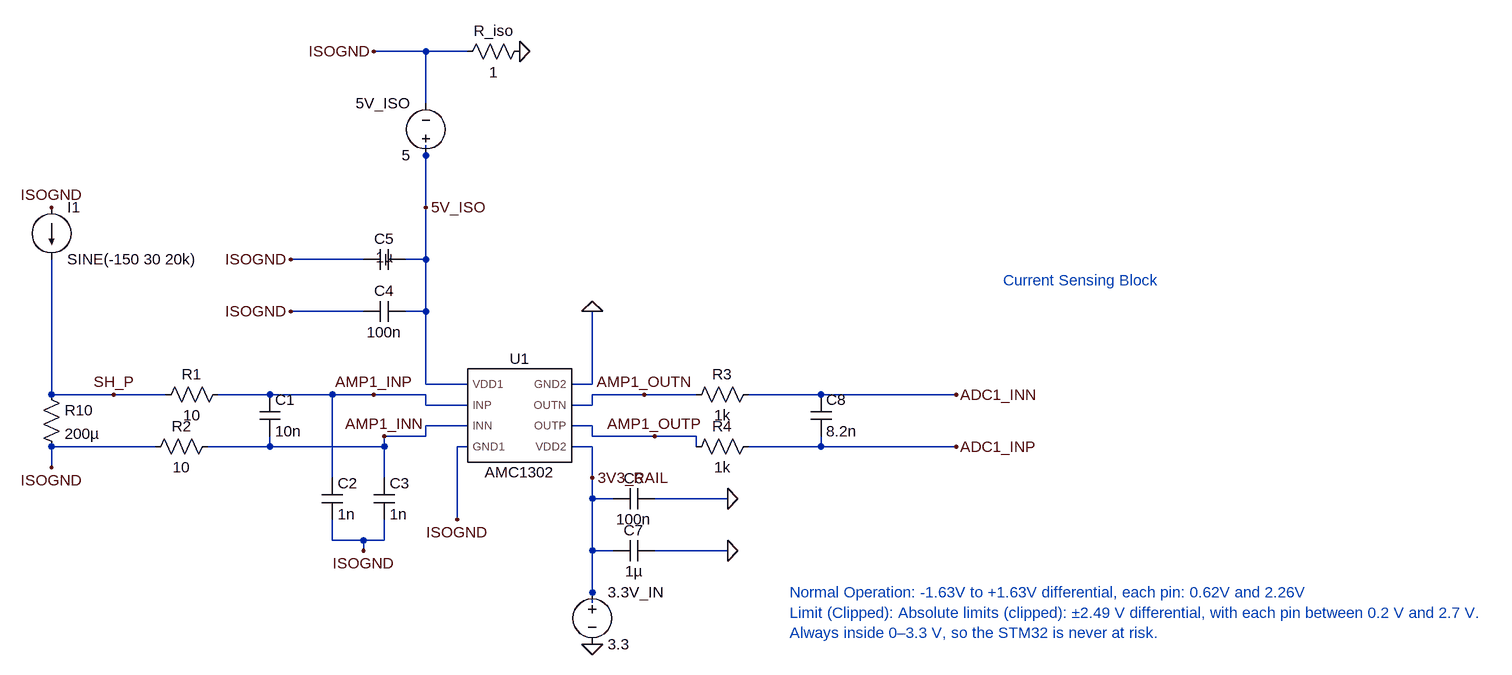
[diagram p0: schematic current_block1.asc]
current_block1.asc, the LTspice schematic file:
Version 4.1
SHEET 1 2132 1664
WIRE 384 -368 304 -368
WIRE 448 -368 384 -368
WIRE 384 -288 384 -368
WIRE 384 -208 384 -224
WIRE 384 -128 384 -208
WIRE 288 -48 176 -48
WIRE 384 -48 384 -128
WIRE 384 -48 352 -48
WIRE 288 32 176 32
WIRE 384 32 384 -48
WIRE 384 32 352 32
WIRE 384 144 384 32
WIRE 448 144 384 144
WIRE 640 144 640 32
WIRE 640 144 608 144
WIRE -192 160 -192 -48
WIRE -96 160 -192 160
WIRE -16 160 -96 160
WIRE 144 160 64 160
WIRE 240 160 144 160
WIRE 304 160 240 160
WIRE 384 160 304 160
WIRE 720 160 640 160
WIRE 800 160 720 160
WIRE 992 160 880 160
WIRE 1200 160 992 160
WIRE 384 176 384 160
WIRE 448 176 384 176
WIRE 640 176 640 160
WIRE 640 176 608 176
WIRE 448 208 384 208
WIRE 640 208 608 208
WIRE 384 224 384 208
WIRE 384 224 320 224
WIRE 640 224 640 208
WIRE 736 224 640 224
WIRE 800 224 736 224
WIRE -32 240 -192 240
WIRE 144 240 144 224
WIRE 144 240 48 240
WIRE 320 240 320 224
WIRE 320 240 144 240
WIRE 448 240 432 240
WIRE 640 240 608 240
WIRE 800 240 800 224
WIRE 992 240 992 224
WIRE 992 240 880 240
WIRE 1200 240 992 240
WIRE -192 272 -192 240
WIRE 240 288 240 160
WIRE 320 288 320 240
WIRE 640 288 640 240
WIRE 640 320 640 288
WIRE 672 320 640 320
WIRE 848 320 736 320
WIRE 432 352 432 240
WIRE 240 384 240 352
WIRE 288 384 240 384
WIRE 320 384 320 352
WIRE 320 384 288 384
WIRE 288 400 288 384
WIRE 640 400 640 320
WIRE 672 400 640 400
WIRE 848 400 736 400
WIRE 640 464 640 400
WIRE 640 480 640 464
FLAG 176 -48 ISOGND
FLAG 176 32 ISOGND
FLAG 432 352 ISOGND
FLAG 848 400 0
FLAG 848 320 0
FLAG 640 32 0
FLAG 1200 160 ADC1_INN
FLAG 1200 240 ADC1_INP
FLAG 288 400 ISOGND
FLAG 304 -368 ISOGND
FLAG 640 544 0
FLAG 528 -368 0
FLAG -192 -128 ISOGND
FLAG -192 272 ISOGND
FLAG -96 160 SH_P
FLAG 304 160 AMP1_INP
FLAG 320 224 AMP1_INN
FLAG 640 288 3V3_RAIL
FLAG 736 224 AMP1_OUTP
FLAG 720 160 AMP1_OUTN
FLAG 384 -128 5V_ISO
SYMBOL res 80 144 R90
WINDOW 0 0 56 VBottom 2
WINDOW 3 32 56 VTop 2
SYMATTR InstName R1
SYMATTR Value 10
SYMBOL res 64 224 R90
WINDOW 0 0 56 VBottom 2
WINDOW 3 32 56 VTop 2
SYMATTR InstName R2
SYMATTR Value 10
SYMBOL cap 128 160 R0
SYMATTR InstName C1
SYMATTR Value 10n
SYMBOL cap 224 288 R0
SYMATTR InstName C2
SYMATTR Value 1n
SYMBOL cap 304 288 R0
SYMATTR InstName C3
SYMATTR Value 1n
SYMBOL cap 352 16 R90
WINDOW 0 0 32 VBottom 2
WINDOW 3 32 32 VTop 2
SYMATTR InstName C4
SYMATTR Value 100n
SYMBOL cap 352 -64 R90
WINDOW 0 0 32 VBottom 2
WINDOW 3 28 32 VBottom 2
SYMATTR InstName C5
SYMATTR Value 1µ
SYMBOL AMC1302 528 192 R0
SYMATTR InstName U1
SYMBOL cap 672 336 R270
WINDOW 0 32 32 VTop 2
WINDOW 3 0 32 VBottom 2
SYMATTR InstName C6
SYMATTR Value 100n
SYMBOL cap 672 416 R270
WINDOW 0 32 32 VTop 2
WINDOW 3 0 32 VBottom 2
SYMATTR InstName C7
SYMATTR Value 1µ
SYMBOL res 896 224 R90
WINDOW 0 0 56 VBottom 2
WINDOW 3 32 56 VTop 2
SYMATTR InstName R4
SYMATTR Value 1k
SYMBOL res 896 144 R90
WINDOW 0 0 56 VBottom 2
WINDOW 3 32 56 VTop 2
SYMATTR InstName R3
SYMATTR Value 1k
SYMBOL cap 976 160 R0
SYMATTR InstName C8
SYMATTR Value 8.2n
SYMBOL res -208 144 R0
SYMATTR InstName R10
SYMATTR Value 200µ
SYMBOL current -192 -128 R0
WINDOW 123 0 0 Left 0
WINDOW 39 0 0 Left 0
SYMATTR InstName I1
SYMATTR Value SINE(-150 30 20k)
SYMBOL voltage 384 -192 R180
WINDOW 0 24 96 Left 2
WINDOW 3 24 16 Left 2
WINDOW 123 0 0 Left 0
WINDOW 39 0 0 Left 0
SYMATTR InstName 5V_ISO
SYMATTR Value 5
SYMBOL voltage 640 448 R0
WINDOW 123 0 0 Left 0
WINDOW 39 0 0 Left 0
SYMATTR InstName 3.3V_IN
SYMATTR Value 3.3
SYMBOL res 544 -384 R90
WINDOW 0 0 56 VBottom 2
WINDOW 3 32 56 VTop 2
SYMATTR InstName R_iso
SYMATTR Value 1
TEXT 1272 -16 Left 2 ;Current Sensing Block
TEXT 944 464 Left 2 ;Normal Operation: -1.63V to +1.63V differential, each pin: 0.62V and 2.26V\nLimit (Clipped): Absolute limits (clipped): ±2.49 V differential, with each pin between 0.2 V and 2.7 V. \nAlways inside 0–3.3 V, so the STM32 is never at risk.

The netlist it stands for:
* current_block1.asc
R1 AMP1_INP SH_P 10
R2 AMP1_INN ISOGND 10
C1 AMP1_INP AMP1_INN 10n
C2 AMP1_INP ISOGND 1n
C3 AMP1_INN ISOGND 1n
C4 5V_ISO ISOGND 100n
C5 5V_ISO ISOGND 1µ
X§U1 5V_ISO AMP1_INP AMP1_INN ISOGND 0 AMP1_OUTN AMP1_OUTP 3V3_RAIL AMC1302  ; pins VDD1 INP INN GND1 GND2 OUTN OUTP VDD2
C6 3V3_RAIL 0 100n
C7 3V3_RAIL 0 1µ
R4 ADC1_INP AMP1_OUTP 1k
R3 ADC1_INN AMP1_OUTN 1k
C8 ADC1_INN ADC1_INP 8.2n
R10 SH_P ISOGND 200µ
I1 ISOGND SH_P SINE(-150 30 20k)
V§5V_ISO 5V_ISO ISOGND 5
V§3.3V_IN 3V3_RAIL 0 3.3
R_iso 0 ISOGND 1
* Current Sensing Block
* Normal Operation: -1.63V to +1.63V differential, each pin: 0.62V and 2.26V
* Limit (Clipped): Absolute limits (clipped): ±2.49 V differential, with each pin between 0.2 V and 2.7 V.
* Always inside 0–3.3 V, so the STM32 is never at risk.
.lib Amc1302.lib
.backanno
.end